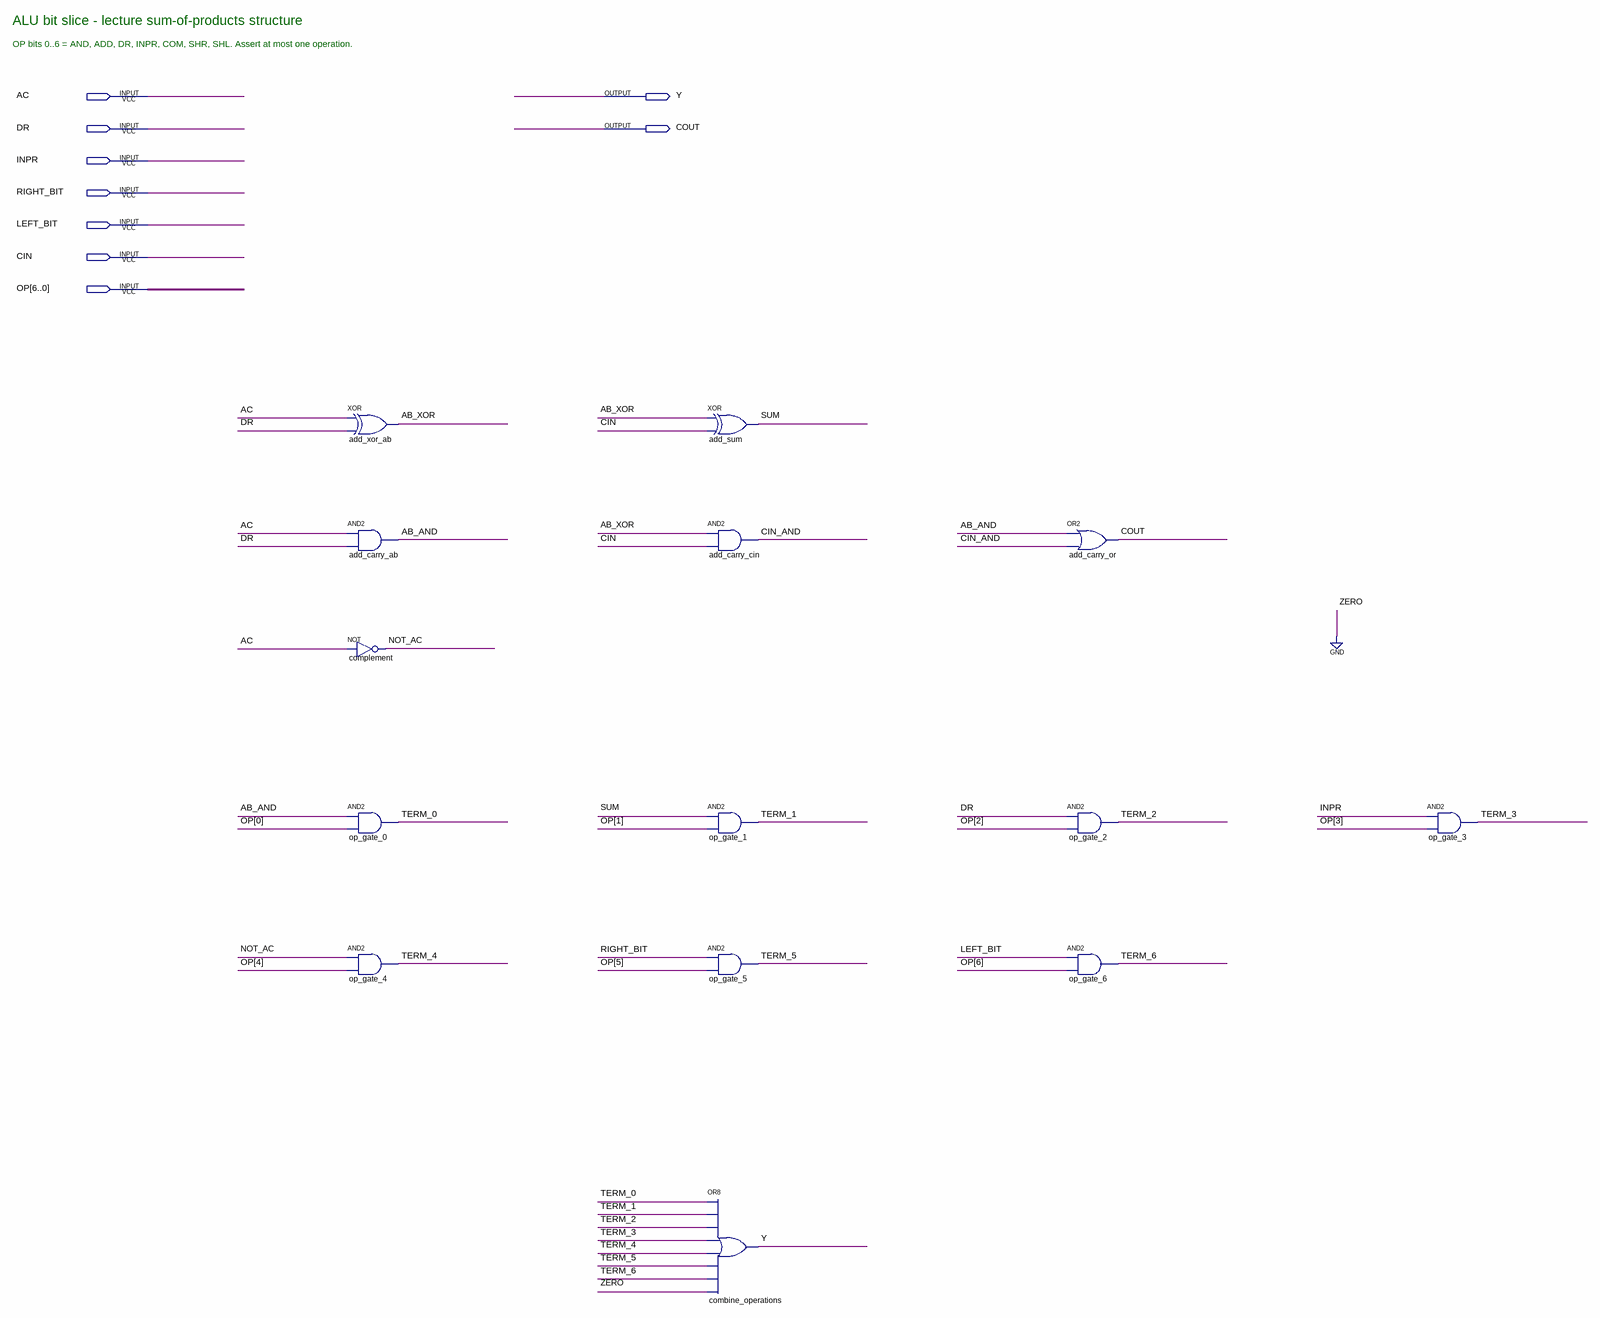
[diagram p0: schematic sheet]
// Quartus schematic alu_slice.bdf as structural Verilog: 14 symbols, 9 pins
module alu_slice (
  input  AC,
  input  DR,
  input  INPR,
  input  RIGHT_BIT,
  input  LEFT_BIT,
  input  CIN,
  input  [6:0] OP,
  output Y,
  output COUT
);

  wire AB_AND, AB_XOR, CIN_AND, NOT_AC, SUM, TERM_0, TERM_1, TERM_2, TERM_3, TERM_4, TERM_5, TERM_6;

  xor add_xor_ab (AB_XOR, AC, DR);
  and add_carry_ab (AB_AND, AC, DR);
  not complement (NOT_AC, AC);
  and op_gate_0 (TERM_0, AB_AND, OP[0]);
  and op_gate_4 (TERM_4, NOT_AC, OP[4]);
  xor add_sum (SUM, AB_XOR, CIN);
  and add_carry_cin (CIN_AND, AB_XOR, CIN);
  and op_gate_1 (TERM_1, SUM, OP[1]);
  and op_gate_5 (TERM_5, RIGHT_BIT, OP[5]);
  or combine_operations (Y, TERM_0, TERM_1, TERM_2, TERM_3, TERM_4, TERM_5, TERM_6, 1'b0);
  or add_carry_or (COUT, AB_AND, CIN_AND);
  and op_gate_2 (TERM_2, DR, OP[2]);
  and op_gate_6 (TERM_6, LEFT_BIT, OP[6]);
  and op_gate_3 (TERM_3, INPR, OP[3]);

  // Notes on the sheet:
  //   ALU bit slice - lecture sum-of-products structure
  //   OP bits 0..6 = AND, ADD, DR, INPR, COM, SHR, SHL. Assert at most one operation.
endmodule
